# Altium project OFP_MCM_v1.6.PrjPcb (part 7 of 7)
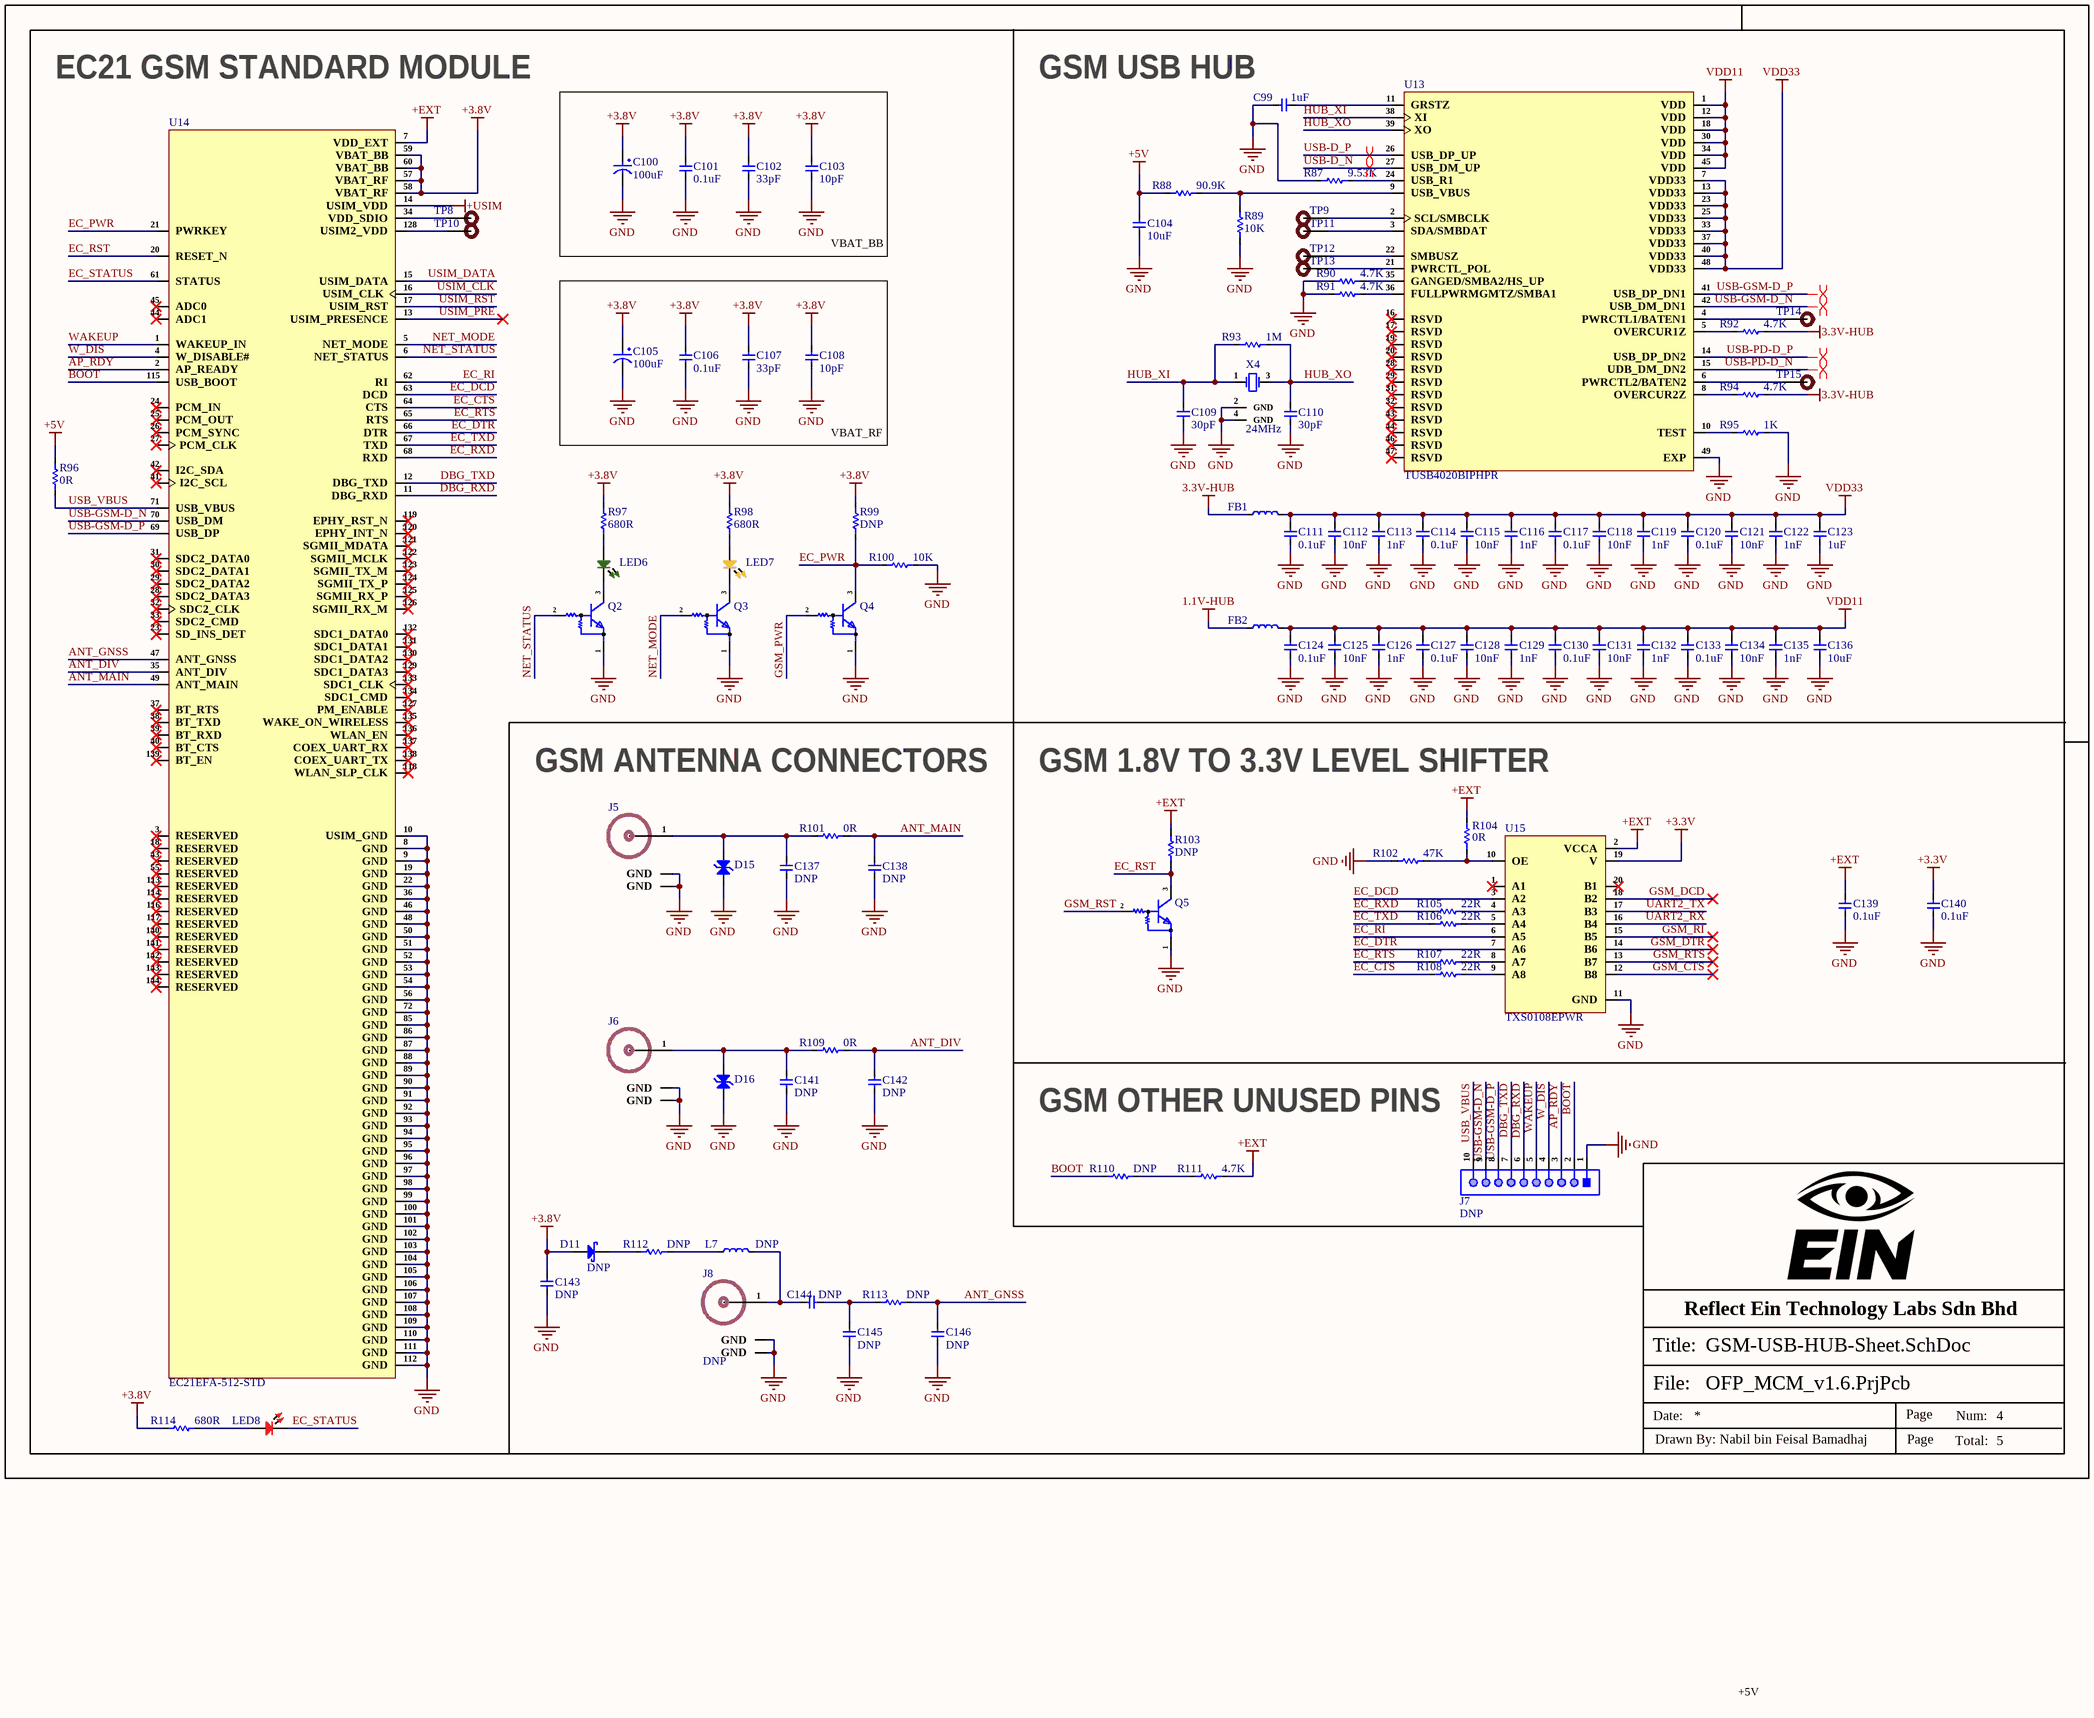
[diagram p10: GSM-USB-HUB-Sheet.SchDoc]

## Sheet GSM-USB-HUB-Sheet.SchDoc (continued)

### Library data of the parts (continued)
R102 = RC0603FR-0747KL: RES 47K OHM 1% 1/10W 0603; Manufacturer: Yageo; Item Type: Resistors; Value: 47kR; Temperature Coefficient: 100ppm/°C; Voltage Rating (DC): 50V; Power Rating: 100mW; Supplier: Rs; LCSC Part Number: C105579; Manufacturer Part Number: RC0603FR-0747KL; RoHS: Yes; Stock: 3100; Pricing: 100=0.078, 1000=0.071, 2500=0.068, 5000=0.062, 10000=0.057 (SEK); Case/Package: 0603; Pins: 2; Case Code (Metric): 1608; Case Code (Imperial): 0603; Min Operating Temperature: -55°C; Max Operating Temperature: 155°C; Tolerance: 1%; Resistor Type: Thick Film; Packaging: Tape and Reel; Voltage Rating: 50V; Package Quantity: 1; Number of Terminations: 2; Termination: SMD/SMT; Max Power Dissipation: 100mW; Features: Moisture Resistant; Series: RC; Resistance Tolerance: 1%; Technology: THICK FILM; Voltage Rating (AC): 50V; Length: 0.063inch; Width: 0.031inch; Height: 0.022inch; Depth: 0.8mm; Radiation Hardening: 5898YesNo; Reach SVHC Compliant: Unknown; Lead Free: 5697LeadFree; RoHS Compliant: Yes
R104 R110 = RC0603FR-070RL: as R39 on sheet Power-Sheet; Manufacturer Part Number: RC0603FR-070RL; Package: 0603; LCSC Part Number: C100044; ComponentLink9Description: LCSC; ComponentLink9URL: https://www.lcsc.com/product-detail/Chip-Resistor-Surface-Mount_YAGEO-RC0603FR-070RL_C100044.html
R105-R108 = RC0603FR-0722RL: RES 22 OHM 1% 1/10W 0603; Manufacturer: Yageo; Temperature Coefficient: 100ppm/°C; Voltage Rating (DC): 50V; Power Rating: 100mW; Item Type: Resistor; Supplier 1: Avnet; Manufacturer Part Number: RC0603FR-0722RL; RoHS: Yes; Category: Chip SMD Resistors; Stock 1: 190000; Pricing 1: 5000=0.00133, 10000=0.00131, 20000=0.00127 (USD); Case/Package: 0603; Number of Pins: 2; Case Code (Metric): 1608; Case Code (Imperial): 0603; Size Code: 0603; Min Operating Temperature: -55°C; Max Operating Temperature: 155°C; Tolerance: 1%; Resistance: 22R; Resistor Type: Thick Film; Packaging: Tape and Reel; Voltage Rating: 50V; Package Quantity: 1; Number of Terminations: 2; Termination: SMD/SMT; Max Power Dissipation: 100mW; Features: Moisture Resistant; Series: RC; Resistance Tolerance: 1%; Technology: THICK FILM; Construction: Rectangular; Length: 0.063inch; Width: 0.031inch; Height: 0.022inch; Depth: 0.8mm; Reach SVHC Compliant: Yes; Lead Free: Lead Free; Military Standard: Not; RoHS Compliant: Yes; ComponentLink1URL: https://datasheet.ciiva.com/11819/0900766b80f96399-11819285.pdf?src-supplier=RSComponents; ComponentLink1Description: https://datasheet.ciiva.com/11819/0900766b80f96399-11819285.pdf?src-supplier=RSComponents; ComponentLink2URL: https://datasheet.ciiva.com/46395/443971-46395032.pdf?src-supplier=Element14; ComponentLink2Description: https://datasheet.ciiva.com/46395/443971-46395032.pdf?src-supplier=Element14; ComponentLink3URL: https://datasheet.ciiva.com/46440/1868787-46440901.pdf?src-supplier=Element14; ComponentLink3Description: https://datasheet.ciiva.com/46440/1868787-46440901.pdf?src-supplier=Element14; ComponentLink4URL: https://datasheet.ciiva.com/2454/pyu-r-int-thick-7-2454355.pdf?src-supplier=Digi-Key; ComponentLink4Description: https://datasheet.ciiva.com/2454/pyu-r-int-thick-7-2454355.pdf?src-supplier=Digi-Key; ComponentLink5URL: https://datasheet.ciiva.com/2454/pyu-r-int-thick-7-2454356.pdf?src-supplier=Digi-Key; ComponentLink5Description: https://datasheet.ciiva.com/2454/pyu-r-int-thick-7-2454356.pdf?src-supplier=Digi-Key; ComponentLink6URL: https://datasheet.ciiva.com/2454/pyu-r-int-thick-7-2454354.pdf?src-supplier=Digi-Key; ComponentLink6Description: https://datasheet.ciiva.com/2454/pyu-r-int-thick-7-2454354.pdf?src-supplier=Digi-Key; Supplier Part Number 1: RC0603FR-0722RL; LCSC Part Number: C107701
R111 = RC0603FR-074K7L: RES SMD 4.7K OHM 1% 1/10W 0603; Manufacturer: Yageo; Item Type: Resistor; Manufacturer Part Number: RC0603FR-074K7L; Package: 0603; ComponentLink7Description: LCSC; ComponentLink7URL: https://www.lcsc.com/product-detail/Chip-Resistor-Surface-Mount_YAGEO-RC0603FR-074K7L_C99782.html; LCSC Part Number: C99782
R112 = RC0603FR-0710RL: RES SMD 10 OHM 1% 1/10W 0603; Manufacturer: Yageo; Resistance: 10R; Temperature Coefficient: 200ppm/°C; Power Rating: 100mW; Voltage Rating: 50V; Item type: Resistor; Supplier 1: Digi-Key; Manufacturer Part Number: RC0603FR-0710RL; Stock 1: 10836596; Pricing 1: 1=0.1, 10=0.046, 100=0.0187, 1000=0.0084, 2500=0.00729 (USD); Case/Package: 0603; Number of Pins: 2; Case Code (Imperial): 0603; Case Code (Metric): 1608; Contact Plating: Tin,Matte; Min Operating Temperature: -55°C; Max Operating Temperature: 155°C; Tolerance: 1%; Composition: Thick Film; Packaging: Tape and Reel; Voltage Rating (DC): 50V; Termination: SMD/SMT; Military Standard: Not; Length: 1.6mm; Height: 0.45mm; Width: 0.8mm; Depth: 0.8mm; Radiation Hardening: No; Lead Free: Lead Free; REACH SVHC: No SVHC; ComponentLink1URL: http://www.farnell.com/datasheets/1868787.pdf?src-supplier=Element14; ComponentLink1Description: http://www.farnell.com/datasheets/1868787.pdf?src-supplier=Element14; ComponentLink2URL: http://www.yageo.com/documents/recent/PYu-RC0603_51_RoHS_L_4.pdf?src-supplier=Avnet; ComponentLink2Description: http://www.yageo.com/documents/recent/PYu-RC0603_51_RoHS_L_4.pdf?src-supplier=Avnet; ComponentLink3URL: http://documents.rs-components.com/techlib://itc_doclist_GB.htm?stockno=5048984&src-supplier=RSComponents; ComponentLink3Description: http://documents.rs-components.com/techlib://itc_doclist_GB.htm?stockno=5048984&src-supplier=RSComponents; ComponentLink4URL: http://www.yageo.com/documents/recent/PYu-RC0603_51_RoHS_L_4.pdf?src-supplier=Avnet+Europe; ComponentLink4Description: http://www.yageo.com/documents/recent/PYu-RC0603_51_RoHS_L_4.pdf?src-supplier=Avnet+Europe; Supplier Part Number 1: 311-10.0HRDKR-ND; LCSC Part Number: C109318
R113 = RC0402FR-070RL: RES 0 OHM JUMPER 1/16W 0402; Manufacturer: Yageo; Item Type: Resistors; Resistance: 0R; Tolerance: 1%; Power Rating: 62.5mW; Voltage Rating: 50V; Temperature Coefficient: 200ppm/°C; Max Power Dissipation: 63mW; Supplier 1: Mouser; Manufacturer Part Number: RC0402FR-070RL; RoHS: Yes; Stock 1: 8556842; Pricing 1: 1=0.10000, 10=0.01400, 50=0.01400, 100=0.00600, 1000=0.00300, 5000=0.00200, 10000=0.00100 (USD); Mount: Surface Mount; Case/Package: 0402; Contact Plating: Tin,Matte; Case Code (Imperial): 0402; Case Code (Metric): 1005; Size Code: 0402; Min Operating Temperature: -55°C; Max Operating Temperature: 155°C; Resistor Type: Thick Film; Packaging: Tape and Reel; Termination: SMD/SMT; Features: Moisture Resistant; Series: RC; Number of Terminations: 2; Length: 1mm; Width: 0.5mm; Height: 0.35mm; Radiation Hardening: No; Lead Free: Lead Free; RoHS Compliant: Yes; ComponentLink1URL: https://datasheet.ciiva.com/8896/pyu-rc0402-51-rohs-l-6-8896149.pdf?src-supplier=Avnet; ComponentLink1Description: https://datasheet.ciiva.com/8896/pyu-rc0402-51-rohs-l-6-8896149.pdf?src-supplier=Avnet; ComponentLink2URL: https://datasheet.ciiva.com/16790/pyu-rc0402-51-rohs-l-6-r-16790444.pdf?src-supplier=Future+Electronics; ComponentLink2Description: https://datasheet.ciiva.com/16790/pyu-rc0402-51-rohs-l-6-r-16790444.pdf?src-supplier=Future+Electronics; Supplier Part Number 1: 603-RC0402FR-070RL; LCSC Part Number: C106231
TP8-TP15 = TEST POINT 0.5mm Dia: Test Point ON; Item Type: Test Point; Manufacturer Part Number: TEST POINT 0.5mm Dia
U13 = TUSB4020BIPHPR: IC USB 2.0 2PORT HUB IND 48HTQFP; Manufacturer: Texas Instruments; Supplier: Mouser; LCSC Part Number: C2864320; Manufacturer Part Number: TUSB4020BIPHPR; RoHS: Yes; Item Type: IC; Stock: 2703; Pricing: 1=4.5, 10=3.15, 50=3.15, 100=2.85, 1000=2.55, 10000=2.52 (USD); ComponentLink1URL: http://www.ti.com/lit/ds/symlink/tusb4020bi.pdf?src-supplier=Digikey; ComponentLink1Description: http://www.ti.com/lit/ds/symlink/tusb4020bi.pdf?src-supplier=Digikey; ComponentLink2URL: http://www.ti.com/general/docs/suppproductinfo.tsp?distId=10&amp;gotoUrl=http%3A%2F%2Fwww.ti.com%2Flit%2Fgpn%2Ftusb4020bi&src-supplier=Digikey; ComponentLink2Description: http://www.ti.com/general/docs/suppproductinfo.tsp?distId=10&amp;gotoUrl=http%3A%2F%2Fwww.ti.com%2Flit%2Fgpn%2Ftusb4020bi&src-supplier=Digikey
U14 = EC21EFA-512-STD: RF TXRX MOD CELLULARCARD EDGE; Manufacturer: Quectel Wireless Solutions; Item Type: IC; Supplier: Mouser; Supplier Part Number: 277-EC21EFA-512-STD; Manufacturer Part Number: EC21EFA-512-STD; RoHS: No; Stock: 210; Pricing: 1=59.46, 10=47.77, 50=42.24, 100=40.31, 1000=38.16, 10000=38.16 (USD); ComponentLink1URL: https://datasheet.octopart.com/EC21EFA-512-STD-Quectel-datasheet-163886073.pdf?src-supplier=SOS+electronic; ComponentLink1Description: https://datasheet.octopart.com/EC21EFA-512-STD-Quectel-datasheet-163886073.pdf?src-supplier=SOS+electronic
U15 = TXS0108EPWR: IC TRANSLATOR BIDIR 20TSSOP; Manufacturer: Texas Instruments; Manufacturer Part Number: TXS0108EPWR; Package: 20-TSSOP; LCSC Part Number: C17206; Item Type: IC; ComponentLink1Description: LCSC; ComponentLink1URL: https://www.lcsc.com/product-detail/Translators-Level-Shifters_Texas-Instruments-TXS0108EPWR_C17206.html
X4 = X503224MSB4SI: 24MHz Surface Mount Crystal 20pF ±10ppm ±20ppm SMD5032-4P Crystals ROHS; Manufacturer: YXC; Supplier: LCSC; LCSC Part Number: C112587; Manufacturer Part Number: X503224MSB4SI; RoHS: No; Item Type: Crystal; Stock: 390; Pricing: 5=0.2572, 50=0.2054, 150=0.1832, 1000=0.1377, 2000=0.1253, 5000=0.1179 (USD)

## Sheet Others-Sheet.SchDoc
size 420 x 297 mm; SheetNumber: 5; SheetTotal: 5
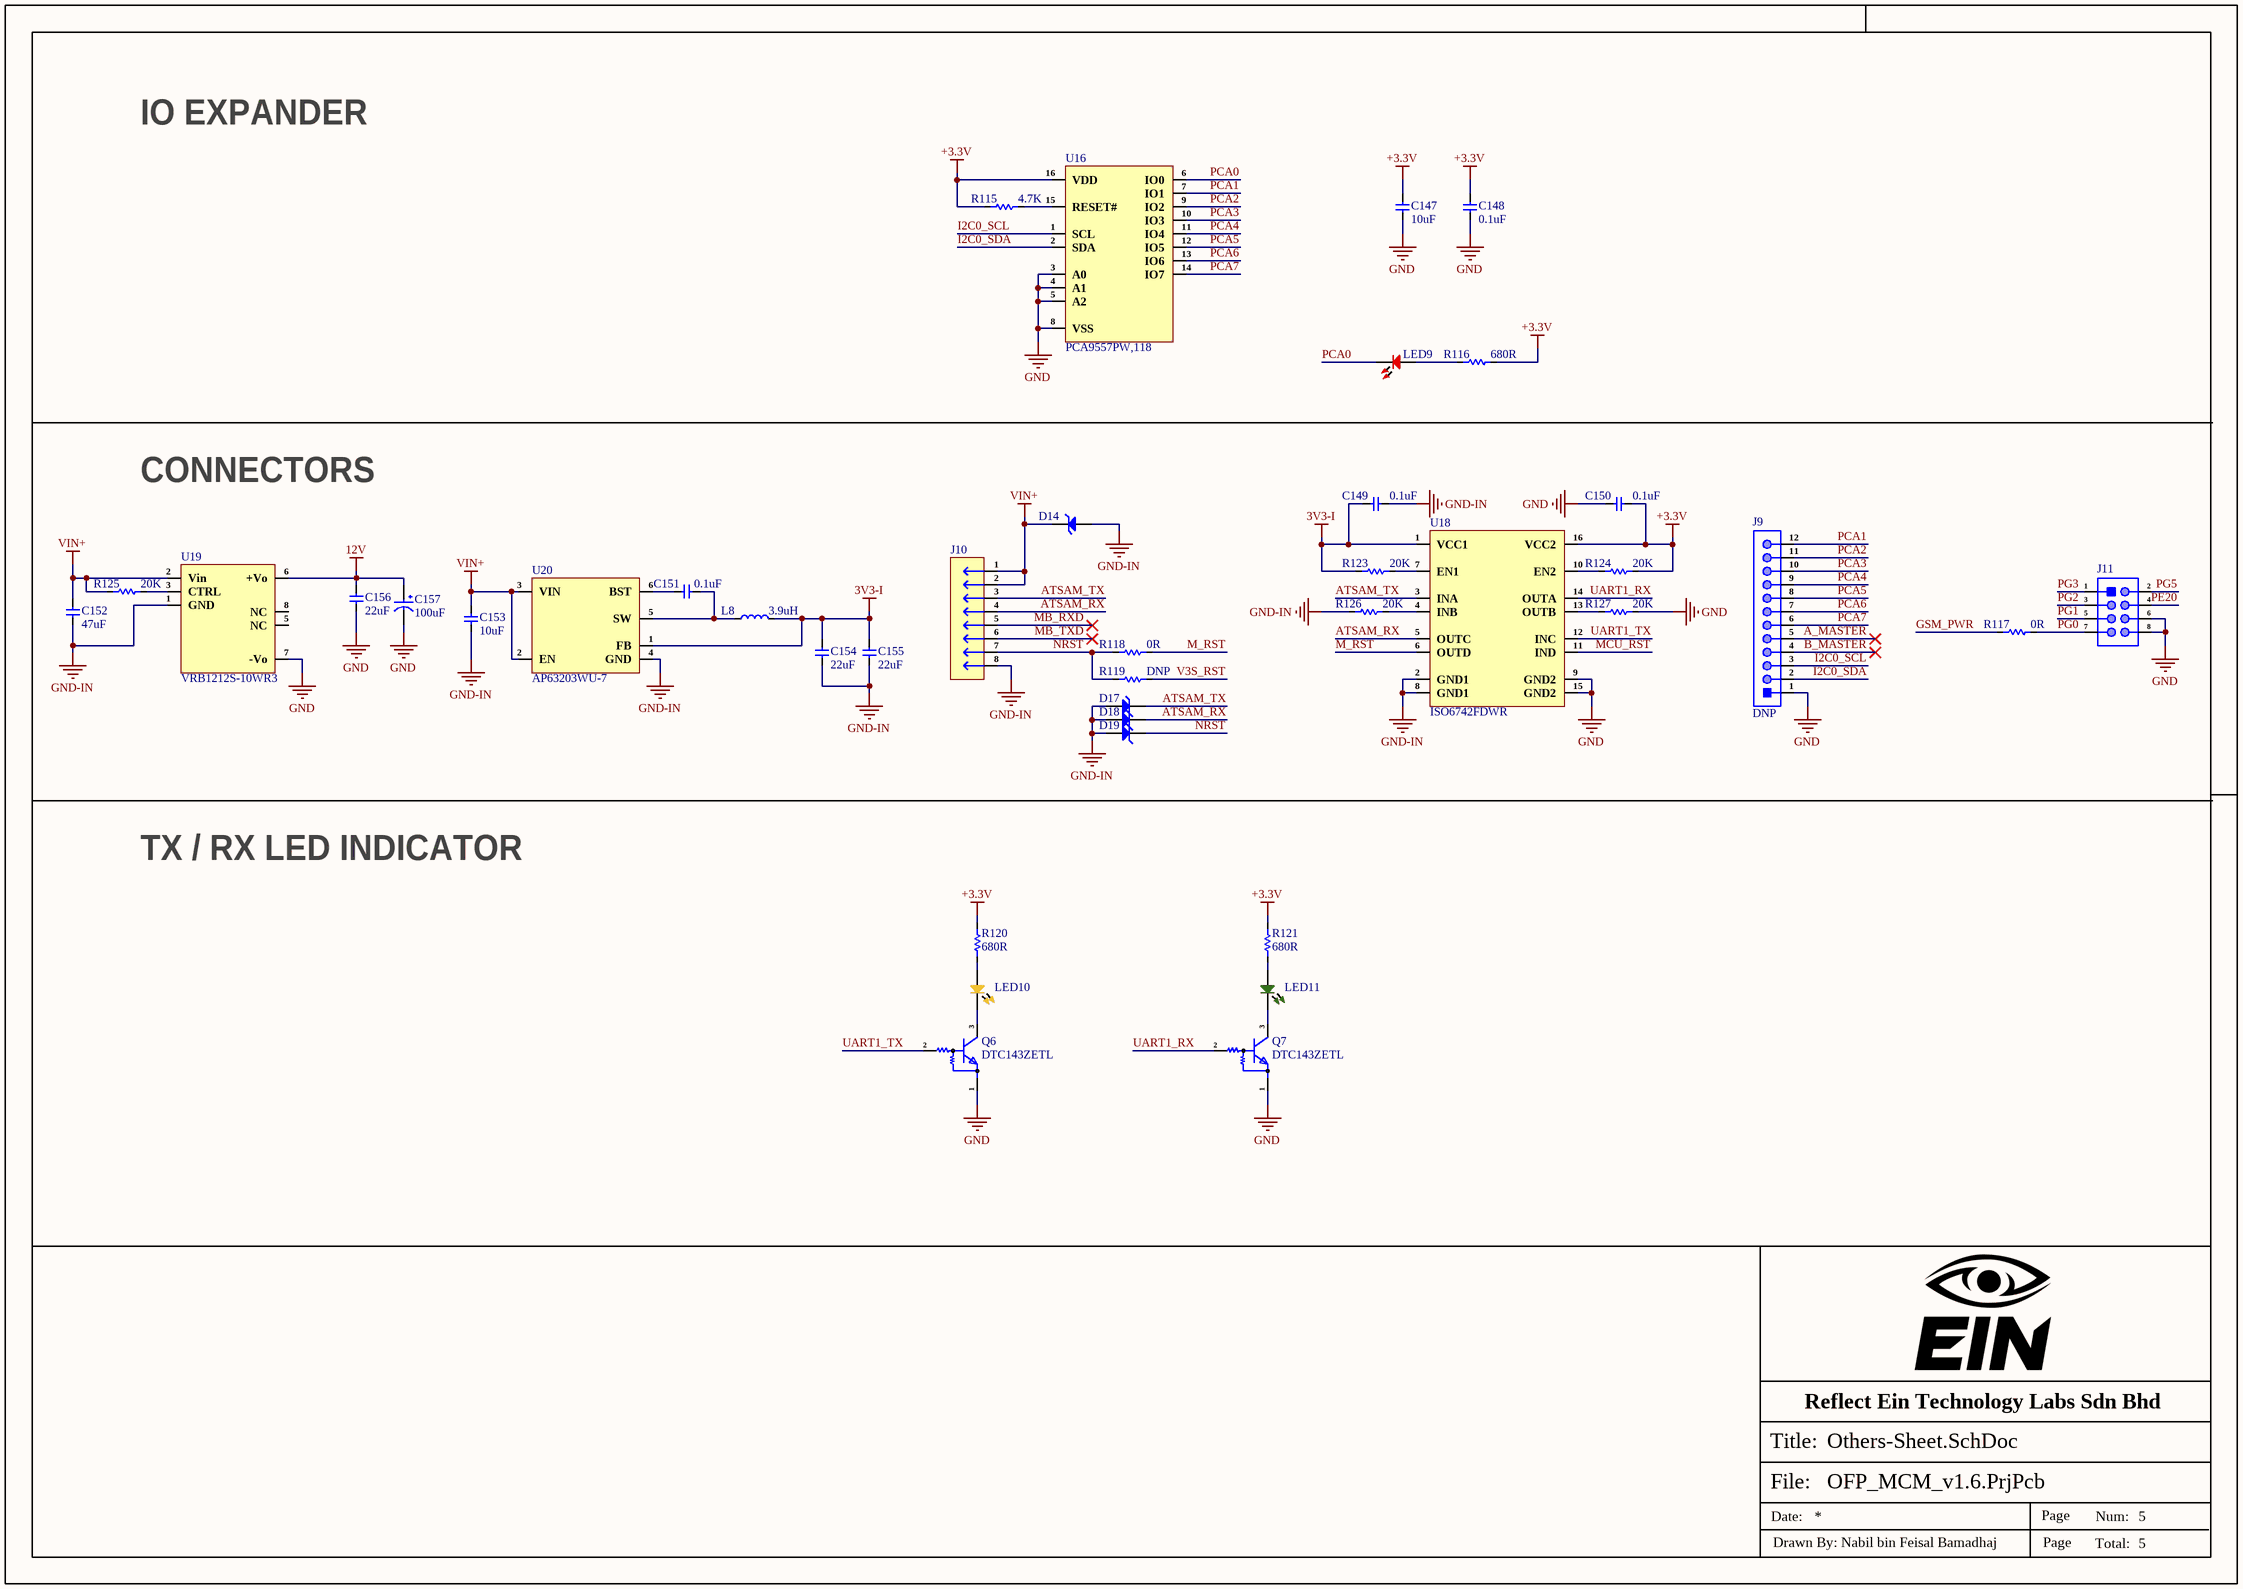
[diagram p4: Others-Sheet.SchDoc]

### Parts
C147  10uF  [Cap-0603]
C148  0.1uF  [Cap-0402]
C149  0.1uF  [Cap-0402]
C150  0.1uF  [Cap-0402]
C151  0.1uF  [Cap-0603]
C152  47uF  [Cap-1206]
C153  10uF  [Cap-1210]
C154  22uF  [Cap-0805]
C155  22uF  [Cap-0805]
C156  22uF  [Cap-0805]
C157  100uF  [Case-E]
D14  SMBJ12A  [SMB_]  (value not drawn)
D17  SMF3.3  [SOD-123FL]  (value not drawn)
D18  SMF3.3  [SOD-123FL]  (value not drawn)
D19  SMF3.3  [SOD-123FL]  (value not drawn)
J9  DNP  [HDR 1x12 TH]
J10  B8B-XH-A(LF)(SN)  [B8B-XH-A(LF)(SN)]  (value not drawn)
J11  X6521WV-2x04H-C60D30  [HDR 2X4 (2.54mm Male)]  (value not drawn)
L8  3.9uH  [FNR4030S3R9MT]
LED9  RED  [LED-0603]  (value not drawn)
LED10  Yellow  [LED-0603]  (value not drawn)
LED11  GREEN  [TH LED 5mm Green]  (value not drawn)
Q6  DTC143ZETL  [SOT-416]
Q7  DTC143ZETL  [SOT-416]
R115  4.7K  [Res-0402]
R116  680R  [Res-0402]
R117  0R  [Res-0402]
R118  0R  [Res-0603]
R119  DNP  [Res-0603]
R120  680R  [Res-0603]
R121  680R  [Res-0603]
R123  20K  [Res-0603]
R124  20K  [Res-0603]
R125  20K  [Res-0603]
R126  20K  [Res-0603]
R127  20K  [Res-0603]
U16  PCA9557PW,118  [TSSOP_16]
U18  ISO6742FDWR  [SOIC-16-300mil]
U19  VRB1212S-10WR3  [VRB1212S-10WR3]
U20  AP63203WU-7  [TSOT-23-6]

### Nets
3V3-I: C149.2 C154.2 C155.2 L8.2 R123.1 U18.1(VCC1) U20.1(FB)
12V: C156.2 C157.1 U19.6(+Vo)
+3.3V: C147.2 C148.2 C150.1 R115.1 R116.2 R120.2 R121.2 R124.2 U16.16(VDD) U18.16(VCC2)
GND: C147.1 C148.1 C150.2 C156.1 C157.2 J9.1 J11.6 J11.8 Q6.1(E) Q7.1(E) R127.2 U16.3(A0) U16.4(A1) U16.5(A2) U16.8(VSS) U18.9(GND2) U18.15(GND2) U19.7(-Vo)
GND-IN: C149.1 C152.1 C153.1 C154.1 C155.1 D14.1(A) D17.2(A) D18.2(A) D19.2(A) J10.8 R126.1 U18.2(GND1) U18.8(GND1) U19.1(GND) U20.4(GND)
V3S_RST: R119.2
VIN+: C152.2 C153.2 D14.2(K) J10.1 J10.2 R125.1 U19.2(Vin) U20.2(EN) U20.3(VIN)
A_MASTER: J9.5
ATSAM_RX: D18.1(K) J10.4 U18.5(OUTC)
ATSAM_TX: D17.1(K) J10.3 U18.3(INA)
B_MASTER: J9.4
GSM_PWR: R117.1
I2C0_SCL: J9.3 U16.1(SCL)
I2C0_SDA: J9.2 U16.2(SDA)
M_RST: R118.2 U18.6(OUTD)
MB_RXD: J10.5
MB_TXD: J10.6
MCU_RST: U18.11(IND)
NRST: D19.1(K) J10.7 R118.1 R119.1
PCA0: LED9.2 U16.6(IO0)
PCA1: J9.12 U16.7(IO1)
PCA2: J9.11 U16.9(IO2)
PCA3: J9.10 U16.10(IO3)
PCA4: J9.9 U16.11(IO4)
PCA5: J9.8 U16.12(IO5)
PCA6: J9.7 U16.13(IO6)
PCA7: J9.6 U16.14(IO7)
PE20: J11.4
PG0: J11.7 R117.2
PG1: J11.5
PG2: J11.3
PG3: J11.1
PG5: J11.2
UART1_RX: Q7.2(B) U18.14(OUTA)
UART1_TX: Q6.2(B) U18.12(INC)
NetC151_1: C151.1 U20.6(BST)
NetC151_2: C151.2 L8.1 U20.5(SW)
NetLED9_1: LED9.1 R116.1
NetLED10_1: LED10.1 R120.1
NetLED10_2: LED10.2 Q6.3(C)
NetLED11_1: LED11.1 Q7.3(C)
NetLED11_2: LED11.2 R121.1
NetR115_2: R115.2 U16.15(RESET#)
NetR123_2: R123.2 U18.7(EN1)
NetR124_1: R124.1 U18.10(EN2)
NetR125_2: R125.2 U19.3(CTRL)
NetR126_2: R126.2 U18.4(INB)
NetR127_1: R127.1 U18.13(OUTB)

Not connected (* = marked no-connect by the designer): U19 5(NC) 8(NC)

### Notes on the sheet
- IO EXPANDER
- CONNECTORS
- TX / RX LED INDICATOR
- Reflect Ein Technology Labs Sdn Bhd
- File:
- Title:
- Date:
- Page
- Num:
- Total:
- Drawn By: Nabil bin Feisal Bamadhaj

### Library data of the parts
C147 = GRM188Z71A106KA73D: CAP CER 10UF 10V X7R 0603; Manufacturer: Murata; Item Type: Capacitor; Material: 4241ConductorMaterial; Tolerance: 10%; Supplier: Mouser; LCSC Part Number: C2959727; Manufacturer Part Number: GRM188Z71A106KA73D; RoHS: Yes; Stock: 390983; Pricing: 1=0.36, 10=0.155, 50=0.155, 100=0.104, 1000=0.094, 10000=0.065 (USD); Case/Package: 345Case; Min Operating Temperature: -55°C; Max Operating Temperature: 125°C; Value: 10uF; Voltage Rating: 10V; Length: 1.6mm; Width: 800um; Height: 1mm; Thickness: 800um; RoHS Compliant: Yes; ComponentLink1URL: https://datasheet.octopart.com/GRM188Z71A106KA73D-Murata-datasheet-165579666.pdf?src-supplier=TME; ComponentLink1Description: https://datasheet.octopart.com/GRM188Z71A106KA73D-Murata-datasheet-165579666.pdf?src-supplier=TME
C148-C150 = GRM155R71E104KE14D: CAP CER 0.1UF 25V X7R 0402; Manufacturer: Murata; Item Type: Capacitors; Dielectric Material: Ceramic; Material: 4241ConductorMaterial; Value: 100nF; Tolerance: 10%; Supplier: Mouser; LCSC Part Number: C77014; Manufacturer Part Number: GRM155R71E104KE14D; RoHS: Yes; Stock: 652368; Pricing: 1=0.1, 10=0.007, 50=0.007, 100=0.005, 1000=0.005, 10000=0.004 (USD); Mounting Technology: Surface Mount; Case/Package: 0402; Pins: 2NUMBER; Case Code (Metric): 1005; Case Code (Imperial): 0402; Weight: 0.000212oz; Min Operating Temperature: -55°C; Max Operating Temperature: 125°C; Packaging: Tape and Reel; Voltage Rating: 25V; Dielectric: X7R; Voltage: 25V; Termination: SMD/SMT; Voltage Rating (DC): 25V; Package Quantity: 10000; Series: GRM; Length: 1mm; Width: 0.02inch; Height: 0.5mm; Thickness: 0.022inch; Depth: 0.5mm; RoHS Compliant: Yes; Reach SVHC Compliant: Unknown; Lead Free: 5697LeadFree; ComponentLink1URL: http://www.farnell.com/datasheets/1872206.pdf?src-supplier=Farnell; ComponentLink1Description: http://www.farnell.com/datasheets/1872206.pdf?src-supplier=Farnell; ComponentLink2URL: http://www.mouser.com/ds/2/281/c02e-2905.pdf?src-supplier=Mouser; ComponentLink2Description: http://www.mouser.com/ds/2/281/c02e-2905.pdf?src-supplier=Mouser; ComponentLink3URL: http://uk.rs-online.com/webdocs/144c/0900766b8144c113.pdf?src-supplier=Rs; ComponentLink3Description: http://uk.rs-online.com/webdocs/144c/0900766b8144c113.pdf?src-supplier=Rs; ComponentLink4URL: https://datasheet.octopart.com/GRM155R71E104KE14D-Murata-datasheet-62346597.pdf?src-supplier=Future+Electronics; ComponentLink4Description: https://datasheet.octopart.com/GRM155R71E104KE14D-Murata-datasheet-62346597.pdf?src-supplier=Future+Electronics; ComponentLink5URL: https://search.murata.co.jp/Ceramy/image/img/A01X/G101/ENG/GRM155R71E104KE14-01.pdf?src-supplier=Digikey; ComponentLink5Description: https://search.murata.co.jp/Ceramy/image/img/A01X/G101/ENG/GRM155R71E104KE14-01.pdf?src-supplier=Digikey; ComponentLink6URL: http://www.farnell.com/datasheets/2048008.pdf?src-supplier=Newark; ComponentLink6Description: http://www.farnell.com/datasheets/2048008.pdf?src-supplier=Newark; ComponentLink7URL: https://datasheet.octopart.com/GRM155R71E104KE14D-Murata-datasheet-62317124.pdf?src-supplier=Element14; ComponentLink7Description: https://datasheet.octopart.com/GRM155R71E104KE14D-Murata-datasheet-62317124.pdf?src-supplier=Element14; ComponentLink8URL: http://psearch.en.murata.com/capacitor/product/GRM155R71E104KE14%23.pdf?src-supplier=Avnet; ComponentLink8Description: http://psearch.en.murata.com/capacitor/product/GRM155R71E104KE14%23.pdf?src-supplier=Avnet
C151 = GCJ188R71H104KA12D: CAP CER 0.1UF 50V X7R 0603; Manufacturer: Murata; Item Type: Capacitors; Material: 4241ConductorMaterial; Value: 100nF; Tolerance: 10%; Supplier: Mouser; LCSC Part Number: C161115; Manufacturer Part Number: GCJ188R71H104KA12D; RoHS: Yes; Stock: 342536; Pricing: 1=0.13, 10=0.056, 50=0.056, 100=0.036, 1000=0.032, 10000=0.02 (USD); Mounting Technology: Surface Mount; Case/Package: 0603; Case Code (Metric): 1608; Case Code (Imperial): 0603; Min Operating Temperature: -55°C; Max Operating Temperature: 125°C; Dielectric: X7R; Package Quantity: 1; Voltage Rating: 50V; Packaging: Tape and Reel; Voltage Rating (DC): 50V; Termination: SMD/SMT; Features: Soft Termination; Series: GCJ; Construction: Flat; Length: 1.6mm; Width: 0.031inch; Height: 0.8mm; Thickness: 0.035inch; Depth: 0.8mm; Ratings: AEC-Q200; Radiation Hardening: No; RoHS Compliant: Yes; Lead Free: 5697LeadFree; ComponentLink1URL: https://datasheet.ciiva.com/135/product-135604.pdf?src-supplier=Digikey; ComponentLink1Description: https://datasheet.ciiva.com/135/product-135604.pdf?src-supplier=Digikey; ComponentLink2URL: https://datasheet.ciiva.com/26889/getdatasheetpartid-369886-26889118.pdf?src-supplier=Verical; ComponentLink2Description: https://datasheet.ciiva.com/26889/getdatasheetpartid-369886-26889118.pdf?src-supplier=Verical; ComponentLink3URL: https://datasheet.ciiva.com/135/s0717e-135605.pdf?src-supplier=Digikey; ComponentLink3Description: https://datasheet.ciiva.com/135/s0717e-135605.pdf?src-supplier=Digikey; ComponentLink4URL: https://datasheet.ciiva.com/135/s0717e-135606.pdf?src-supplier=Digikey; ComponentLink4Description: https://datasheet.ciiva.com/135/s0717e-135606.pdf?src-supplier=Digikey; ComponentLink5URL: https://datasheet.ciiva.com/16440/c03e-16440425.pdf?src-supplier=Future+Electronics; ComponentLink5Description: https://datasheet.ciiva.com/16440/c03e-16440425.pdf?src-supplier=Future+Electronics
C152 = C3216X5R1E476M160AC: CAP CER 47UF 25V X5R 1206; Manufacturer: TDK; Dielectric Material: Ceramic; Tolerance: 20%; Supplier 1: Digi-Key; Manufacturer Part Number: C3216X5R1E476M160AC; Stock 1: 886163; Pricing 1: 1=1.09, 10=0.862, 50=0.7476, 100=0.6469, 500=0.48876, 1000=0.43125 (USD); Mount: Surface Mount; Case/Package: 1206; Case Code (Metric): 3216; Case Code (Imperial): 1206; Weight: 0.000571oz; Min Operating Temperature: -55°C; Max Operating Temperature: 85°C; Capacitance: 47uF; Voltage Rating: 25V; Packaging: Tape and Reel; Voltage Rating (DC): 25V; Termination: SMD/SMT; Series: C; Package Quantity: 1; Dielectric: X5R; Resistor Type: Ceramic; Voltage: 25V; Length: 0.126inch; Width: 0.063inch; Height: 1.6mm; Depth: 1.6mm; Thickness: 0.071inch; Lead Free: Lead Free; REACH SVHC: No SVHC; ComponentLink1URL: https://product.tdk.com/info/en/catalog/datasheets/mlcc_commercial_general_en.pdf?src-supplier=Digi-Key; ComponentLink1Description: https://product.tdk.com/info/en/catalog/datasheets/mlcc_commercial_general_en.pdf?src-supplier=Digi-Key; ComponentLink2URL: https://product.tdk.com/info/en/documents/chara_sheet/C3216X5R1E476M160AC.pdf?src-supplier=Digi-Key; ComponentLink2Description: https://product.tdk.com/info/en/documents/chara_sheet/C3216X5R1E476M160AC.pdf?src-supplier=Digi-Key; ComponentLink3URL: http://www.tdk.com/pdf/general_B11.pdf?src-supplier=Future+Electronics; ComponentLink3Description: http://www.tdk.com/pdf/general_B11.pdf?src-supplier=Future+Electronics; Supplier Part Number 1: 445-8047-1-ND; LCSC Part Number: C2167787
C153 = GRM32ER71H106KA12L: CAP CER 10UF 50V X7R 1210; Manufacturer: Murata; Item Type: Capacitors; Supplier: Future Electronics; LCSC Part Number: C77102; Manufacturer Part Number: GRM32ER71H106KA12L; RoHS: Yes; Stock: 960000; Pricing: 1000=0.325, 2000=0.32, 3000=0.315, 4000=0.315, 5000=0.305 (USD); Lead Free: 5697LeadFree; RoHS Compliant: 5897YesNo; ComponentLink1URL: https://datasheet.ciiva.com/16497/product-16497010.pdf?src-supplier=Future+Electronics; ComponentLink1Description: https://datasheet.ciiva.com/16497/product-16497010.pdf?src-supplier=Future+Electronics; ComponentLink2URL: https://datasheet.ciiva.com/3777/4286grm32er71h106ka1223-3777306.pdf?src-supplier=Arrow+Electronics; ComponentLink2Description: https://datasheet.ciiva.com/3777/4286grm32er71h106ka1223-3777306.pdf?src-supplier=Arrow+Electronics; ComponentLink3URL: https://datasheet.ciiva.com/11789/0900766b80ef921d-11789081.pdf?src-supplier=Rs; ComponentLink3Description: https://datasheet.ciiva.com/11789/0900766b80ef921d-11789081.pdf?src-supplier=Rs; ComponentLink4URL: https://datasheet.ciiva.com/11607/c02e-11607596.pdf?src-supplier=Avnet; ComponentLink4Description: https://datasheet.ciiva.com/11607/c02e-11607596.pdf?src-supplier=Avnet; ComponentLink5URL: https://datasheet.ciiva.com/6270/partnumbering-e-01-6270167.pdf?src-supplier=Digikey; ComponentLink5Description: https://datasheet.ciiva.com/6270/partnumbering-e-01-6270167.pdf?src-supplier=Digikey; ComponentLink6URL: https://datasheet.ciiva.com/6270/partnumbering-e-01-6270168.pdf?src-supplier=Digikey; ComponentLink6Description: https://datasheet.ciiva.com/6270/partnumbering-e-01-6270168.pdf?src-supplier=Digikey; ComponentLink7URL: https://datasheet.ciiva.com/6270/partnumbering-e-01-6270169.pdf?src-supplier=Digikey; ComponentLink7Description: https://datasheet.ciiva.com/6270/partnumbering-e-01-6270169.pdf?src-supplier=Digikey; ComponentLink8URL: https://datasheet.ciiva.com/46441/1754714-46441340.pdf?src-supplier=Element14; ComponentLink8Description: https://datasheet.ciiva.com/46441/1754714-46441340.pdf?src-supplier=Element14
C154 C155 = GRM21BZ70J226ME44L: CAP CER 22UF 6.3V X7R 0805; Manufacturer: Murata; Item Type: Capacitors; Material: 4241ConductorMaterial; Tolerance: 20%; Supplier: Mouser; LCSC Part Number: C1517827; Manufacturer Part Number: GRM21BZ70J226ME44L; RoHS: Yes; Stock: 88243; Pricing: 1=0.41, 10=0.243, 50=0.243, 100=0.154, 1000=0.108, 10000=0.082 (USD); Case/Package: 339Case; Min Operating Temperature: -55°C; Max Operating Temperature: 125°C; Value: 22uF; Voltage Rating: 6.3V; Length: 2mm; Width: 1.25mm; Height: 1.45mm; Thickness: 1.25mm; RoHS Compliant: Yes
C156 = CC0805MKX5R8BB226: CAP CER 22UF 25V X5R 0805; Manufacturer: Yageo; Tolerance: 20%; Item Type: Capacitor; Supplier 1: Digi-Key; Manufacturer Part Number: CC0805MKX5R8BB226; RoHS: Yes; Category: Ceramic Capacitors; Stock 1: 64970; Pricing 1: 1=0.47000, 10=0.33300, 50=0.25140, 100=0.21900, 500=0.16222, 1000=0.13789 (USD); Mount: Surface Mount; Case/Package: 0805; Case Code (Metric): 2012; Case Code (Imperial): 0805; Weight: 0.000194oz; Min Operating Temperature: -55°C; Max Operating Temperature: 85°C; Packaging: Tape and Reel; Capacitance: 22uF; Voltage Rating: 25V; Dielectric: X5R; Termination: SMD/SMT; Voltage Rating (DC): 25V; Package Quantity: 3000; Length: 0.079inch; Width: 0.049inch; Height: 1.25mm; Thickness: 0.057inch; Lead Free: Lead Free; Halogen Free: Halogen Free; RoHS Compliant: Yes; ComponentLink1URL: http://www.mouser.com/ds/2/447/Yageo_UPY-GP_NP0_16V-to-50V_9-358835.pdf?src-supplier=Mouser; ComponentLink1Description: http://www.mouser.com/ds/2/447/Yageo_UPY-GP_NP0_16V-to-50V_9-358835.pdf?src-supplier=Mouser; ComponentLink2URL: http://www.yageo.com/documents/recent/UPY-GPHC_X5R_4V-to-50V_25.pdf?src-supplier=Digi-Key; ComponentLink2Description: http://www.yageo.com/documents/recent/UPY-GPHC_X5R_4V-to-50V_25.pdf?src-supplier=Digi-Key; Supplier Part Number 1: 311-1903-1-ND; LCSC Part Number: C784585
C157 = TAJE107M025RNJ: CAP TANT 100UF 20% 25V 2917; Manufacturer: Kyocera AVX; ESR (Equivalent Series Resistance): 300mR; Leakage Current: 25uA; Polarity: Polar; Dissipation Factor: 10%; Supplier 1: Mouser; Manufacturer Part Number: TAJE107M025RNJ; RoHS: Yes; Category: Tantalum Capacitors; Stock 1: 109; Pricing 1: 1=2.81000, 10=2.81000, 50=2.81000, 100=2.19000, 1000=1.76000, 10000=1.76000 (USD); Mount: Surface Mount; Case/Package: 2917; Number of Pins: 2; Case Code (Imperial): 2917; Case Code (Metric): 7343; Min Operating Temperature: -55°C; Max Operating Temperature: 125°C; Capacitance: 100uF; Tolerance: 20%; Packaging: Tape and Reel; Voltage Rating: 25V; Voltage Rating (DC): 25V; Features: General Purpose; Package Quantity: 1; Termination: SMD/SMT; Series: TAJ; Construction: Flat; Length: 7.3mm; Width: 4.3mm; Height: 4.3mm; Depth: 4.3mm; Height - Seated (Max): 0.169inch; Radiation Hardening: No; Lead Free: Lead Free; RoHS Compliant: Yes; REACH SVHC: No SVHC; ComponentLink1URL: https://datasheet.ciiva.com/26787/taje107m025rnj-26787048.pdf?src-supplier=IIIC; ComponentLink1Description: https://datasheet.ciiva.com/26787/taje107m025rnj-26787048.pdf?src-supplier=IIIC; ComponentLink2URL: https://datasheet.ciiva.com/265/taj-265541.pdf?src-supplier=Digi-Key; ComponentLink2Description: https://datasheet.ciiva.com/265/taj-265541.pdf?src-supplier=Digi-Key; ComponentLink3URL: https://datasheet.ciiva.com/265/taj-265542.pdf?src-supplier=Digi-Key; ComponentLink3Description: https://datasheet.ciiva.com/265/taj-265542.pdf?src-supplier=Digi-Key; ComponentLink4URL: https://datasheet.ciiva.com/265/taj-265540.pdf?src-supplier=Digi-Key; ComponentLink4Description: https://datasheet.ciiva.com/265/taj-265540.pdf?src-supplier=Digi-Key; ComponentLink5URL: https://datasheet.ciiva.com/28609/1719052-28609254.pdf?src-supplier=Element14; ComponentLink5Description: https://datasheet.ciiva.com/28609/1719052-28609254.pdf?src-supplier=Element14; ComponentLink6URL: https://datasheet.ciiva.com/11230/taj-11230456.pdf?src-supplier=Avnet; ComponentLink6Description: https://datasheet.ciiva.com/11230/taj-11230456.pdf?src-supplier=Avnet; ComponentLink7URL: https://datasheet.ciiva.com/17339/taj-17339677.pdf?src-supplier=Avnet+Europe; ComponentLink7Description: https://datasheet.ciiva.com/17339/taj-17339677.pdf?src-supplier=Avnet+Europe; ComponentLink8URL: https://datasheet.ciiva.com/22667/1719052-22667581.pdf?src-supplier=Element14; ComponentLink8Description: https://datasheet.ciiva.com/22667/1719052-22667581.pdf?src-supplier=Element14; Supplier Part Number 1: 581-TAJE107M025RNJ; LCSC Part Number: C7230
D14 = SMBJ12A: TVS DIODE 12VWM 19.9VC DO214AA; Manufacturer: Littelfuse; Item Type: TVS Diodes; Supplier: Digikey; LCSC Part Number: C151251; Manufacturer Part Number: SMBJ12A; RoHS: Yes; Stock: 39718; Pricing: 1=0.32, 10=0.215, 100=0.104 (USD); ComponentLink1URL: https://datasheet.ciiva.com/15143/getdatasheetpartid-185160-15143884.pdf?src-supplier=Verical; ComponentLink1Description: https://datasheet.ciiva.com/15143/getdatasheetpartid-185160-15143884.pdf?src-supplier=Verical; ComponentLink2URL: https://datasheet.ciiva.com/34302/1546611-34302457.pdf?src-supplier=Jameco; ComponentLink2Description: https://datasheet.ciiva.com/34302/1546611-34302457.pdf?src-supplier=Jameco; ComponentLink3URL: https://datasheet.ciiva.com/25624/0900766b810f4eeb-25624681.pdf?src-supplier=Rs; ComponentLink3Description: https://datasheet.ciiva.com/25624/0900766b810f4eeb-25624681.pdf?src-supplier=Rs; ComponentLink4URL: https://datasheet.ciiva.com/16287/littelfuse-tvs-diode-smbj-16287565.pdf?src-supplier=Future+Electronics; ComponentLink4Description: https://datasheet.ciiva.com/16287/littelfuse-tvs-diode-smbj-16287565.pdf?src-supplier=Future+Electronics; ComponentLink5URL: https://datasheet.ciiva.com/331/littelfuse-tvs-diode-smbj-datasheet-pdf-331137.pdf?src-supplier=Digikey; ComponentLink5Description: https://datasheet.ciiva.com/331/littelfuse-tvs-diode-smbj-datasheet-pdf-331137.pdf?src-supplier=Digikey; ComponentLink6URL: https://datasheet.ciiva.com/331/littelfuse-tvs-diode-smbj-datasheet-pdf-331138.pdf?src-supplier=Digikey; ComponentLink6Description: https://datasheet.ciiva.com/331/littelfuse-tvs-diode-smbj-datasheet-pdf-331138.pdf?src-supplier=Digikey; ComponentLink7URL: https://datasheet.ciiva.com/331/littelfuse-tvs-diode-smbj-datasheet-pdf-331139.pdf?src-supplier=Digikey; ComponentLink7Description: https://datasheet.ciiva.com/331/littelfuse-tvs-diode-smbj-datasheet-pdf-331139.pdf?src-supplier=Digikey; ComponentLink8URL: https://datasheet.ciiva.com/8062/littelfuse-tvs-diode-smbj-8062301.pdf?src-supplier=Element14; ComponentLink8Description: https://datasheet.ciiva.com/8062/littelfuse-tvs-diode-smbj-8062301.pdf?src-supplier=Element14
D17-D19 = SMF3.3: TVS DIODE 3.3VWM 6.8VC SOD123F; Manufacturer: Littelfuse; Item Type: TVS Diodes; Breakdown Voltage: 3.4V; Direction: 210Direction; Number of Unidirectional Channels: 1; Reverse Standoff Voltage: 3.3V; Peak Pulse Current: 30A; Peak Pulse Power: 200W; Power Line Protection: No; Diode Type: ZENER; Number of Channels: 1NUMBER; Max Breakdown Voltage: 4.3V; Max Reverse Leakage Current: 500nA; Test Current: 10mA; Supplier: Digikey; LCSC Part Number: C2649858; Manufacturer Part Number: SMF3.3; RoHS: Yes; Stock: 66904; Pricing: 1=0.49, 10=0.313, 100=0.171, 500=0.153, 1000=0.151 (USD); Mounting Technology: Surface Mount; Min Operating Temperature: -55°C; Max Operating Temperature: 150°C; Packaging: Cut Tape; Series: SMF; Min Breakdown Voltage: 3.4V; Reverse Voltage: 3.3V; Height: 1.08mm; RoHS Compliant: Yes
J9 = X6511WV-12H-C60D30: Gold 250V 3A Square Pins 2.5mm 12P 260℃ 6mm -40℃~+105℃ 3mm 2.54mm Plugin Black Brass 2.54mm 1x12P Plugin,P=2.54mm Pin Headers ROHS; Manufacturer: XKB; Item Type: Male Header; Manufacturer Part Number: X6511WV-12H-C60D30; Package: Plugin,P=2.54mm; LCSC Part Number: C725944; ComponentLink1Description: LCSC; ComponentLink1URL: https://www.lcsc.com/product-detail/Pin-Headers_XKB-Connection-X6511WV-12H-C60D30_C725944.html
J10 = B8B-XH-A(LF)(SN): CONN HEADER VERT 8POS 2.5MM; Manufacturer: JST; Item Type: Wire to Board Connector; Contact Resistance: 20mR; Max Current Rating: 3A; Voltage Rating (AC): 250V; Number of Positions: 8; Insulation Resistance: 1GR; Wire/Cable Gauge: 22AWG; Supplier: Rs; LCSC Part Number: C157972; Manufacturer Part Number: B8B-XH-A(LF)(SN); RoHS: Yes; Stock: 14940; Mounting Technology: Through Hole; Contact Material: Brass; Contact Plating: Tin,Lead,Copper; Color: Natural; Housing Color: White; Housing Material: Polyamide; Weight: 28.349523g; Min Operating Temperature: -25°C; Max Operating Temperature: 85°C; Number of Rows: 1; Current Rating: 3A; Voltage Rating: 250V; Packaging: Bulk; Termination: Press-Fit; Fastening Type: Detent; Max Voltage Rating (AC): 250V; Number of Contacts: 8; Orientation: Straight; Series: XH; Contact Type: Male Pin; Length: 22.4mm; Lead Pitch: 2.5mm; Pitch: 2.5mm; Depth: 5.75mm; Reach SVHC Compliant: No; Lead Free: 5697LeadFree; ComponentLink1URL: https://datasheet.ciiva.com/11747/0900766b80826540-11747580.pdf?src-supplier=Rs; ComponentLink1Description: https://datasheet.ciiva.com/11747/0900766b80826540-11747580.pdf?src-supplier=Rs; ComponentLink2URL: https://datasheet.ciiva.com/26894/getdatasheetpartid-440408-26894817.pdf?src-supplier=Verical; ComponentLink2Description: https://datasheet.ciiva.com/26894/getdatasheetpartid-440408-26894817.pdf?src-supplier=Verical
J11 = X6521WV-2x04H-C60D30: Gold 250V 3A Policy 2.5mm 8P -40℃~+105℃ 2.54mm Double Row Black Brass 2.54mm 2x4P Plugin,P=2.54mm Pin Headers ROHS; Manufacturer: XKB; Item Type: Male Pin Header; Manufacturer Part Number: X6521WV-2x04H-C60D30; Package: Plugin,P=2.54mm; LCSC Part Number: C706894; ComponentLink1Description: LCSC; ComponentLink1URL: https://www.lcsc.com/product-detail/Pin-Headers_XKB-Connection-X6521WV-2x04H-C60D30_C706894.html?s_z=n_X6521WV-2x04H-C60D30
L8 = FNR4030S3R9MT: 2.3A 3.9uH ±20% 3.3A SMD,4x4mm Power Inductors ROHS; Manufacturer: cjiang; Manufacturer Part Number: FNR4030S3R9MT; Footprint: Custom; ComponentLink1Description: LCSC; ComponentLink1URL: https://www.lcsc.com/product-detail/Power-Inductors_cjiang-Changjiang-Microelectronics-Tech-FNR4030S3R9MT_C167872.html; LCSC Part Number: C167872; Item Type: Inductor
LED9 = NCD0603R3: RED LED 0603 Light Emitting Diodes; Manufacturer: Foshan NationStar Optoelectronics; Manufacturer Part Number: NCD0603R3; Package: 0603; Item Type: LED; LCSC Part Number: C3151730; ComponentLink1Description: LCSC; ComponentLink1URL: https://www.lcsc.com/product-detail/Light-Emitting-Diodes-LED_Foshan-NationStar-Optoelectronics-NCD0603R3_C3151730.html
LED10 = NCD0603Y2: yellow 0603 Light Emitting Diodes (LED) ROHS; Manufacturer: Foshan NationStar Optoelectronics; Manufacturer Part Number: NCD0603Y2; Package: 0603; LCSC Part Number: C89811; Item Type: LED; ComponentLink1Description: LCSC; ComponentLink1URL: https://www.lcsc.com/product-detail/Light-Emitting-Diodes-LED_Foshan-NationStar-Optoelectronics-NCD0603Y2_C89811.html
LED11 = 333-2SYGD/S530-E2-L: 333-2 Series Yellow Green 5 x 5.9 x 8.6 mm 30° 80 mcd Diffused 2.4 V LED; Manufacturer: Everlight; Supplier: Future Electronics; LCSC Part Number: C99697; Manufacturer Part Number: 333-2SYGD/S530-E2-L; Item Type: LED; Pricing: 500=0.0295, 2000=0.0286, 7500=0.0277, 20000=0.0271, 50000=0.0261 (USD); ComponentLink1URL: https://datasheet.octopart.com/333-2SYGD-S530-E2-L-Everlight-datasheet-27835065.pdf?src-supplier=Future+Electronics; ComponentLink1Description: https://datasheet.octopart.com/333-2SYGD-S530-E2-L-Everlight-datasheet-27835065.pdf?src-supplier=Future+Electronics
Q6 Q7 = DTC143ZETL: TRANS PREBIAS NPN 50V 0.1A EMT3; Manufacturer: Rohm; Item Type: Mosfet; Supplier: Mouser; LCSC Part Number: C111728; Manufacturer Part Number: DTC143ZETL; RoHS: Yes; Stock: 24993; Pricing: 1=0.24, 10=0.145, 50=0.145, 100=0.064, 1000=0.064, 10000=0.04 (USD); ComponentLink1URL: https://datasheet.ciiva.com/988/dtc143z-988064.pdf?src-supplier=Digikey; ComponentLink1Description: https://datasheet.ciiva.com/988/dtc143z-988064.pdf?src-supplier=Digikey; ComponentLink2URL: https://datasheet.ciiva.com/5781/dtc143ze-5781998.pdf?src-supplier=Farnell; ComponentLink2Description: https://datasheet.ciiva.com/5781/dtc143ze-5781998.pdf?src-supplier=Farnell; ComponentLink3URL: https://datasheet.ciiva.com/988/dtc143z-988062.pdf?src-supplier=Digikey; ComponentLink3Description: https://datasheet.ciiva.com/988/dtc143z-988062.pdf?src-supplier=Digikey; ComponentLink4URL: https://datasheet.ciiva.com/988/dtc143z-988063.pdf?src-supplier=Digikey; ComponentLink4Description: https://datasheet.ciiva.com/988/dtc143z-988063.pdf?src-supplier=Digikey
R115 = RC0402FR-074K7L: RES 4.7K OHM 1% 1/16W 0402; Manufacturer: Yageo; Voltage Rating (DC): 50V; Power Rating: 62.5mW; Resistance: 4.7kR; Temperature Coefficient: 100ppm/°C; Max Power Dissipation: 63mW; Item Type: Resistor; Supplier 1: Avnet; Manufacturer Part Number: RC0402FR-074K7L; RoHS: Yes; Category: Chip SMD Resistors; Stock 1: 2420000; Pricing 1: 10000=0.00085 (USD); Case/Package: 0402; Number of Pins: 2; Case Code (Imperial): 0402; Case Code (Metric): 1005; Size Code: 0402; Min Operating Temperature: -55°C; Max Operating Temperature: 155°C; Tolerance: 1%; Voltage Rating: 50V; Packaging: Tape and Reel; Resistor Type: Thick Film; Termination: SMD/SMT; Features: Moisture Resistant; Series: RC; Number of Terminations: 2; Resistance Tolerance: 1%; Construction: Rectangular; Length: 1mm; Width: 0.5mm; Height: 0.32mm; Depth: 0.5mm; Height - Seated (Max): 0.016inch; RoHS Compliant: Yes; Reach SVHC Compliant: Yes; Military Standard: Not; Lead Free: Lead Free; ComponentLink1URL: https://datasheet.ciiva.com/22661/1686128-22661342.pdf?src-supplier=Element14; ComponentLink1Description: https://datasheet.ciiva.com/22661/1686128-22661342.pdf?src-supplier=Element14; ComponentLink2URL: https://datasheet.ciiva.com/7850/1018594-7850022.pdf?src-supplier=Element14; ComponentLink2Description: https://datasheet.ciiva.com/7850/1018594-7850022.pdf?src-supplier=Element14; ComponentLink3URL: https://datasheet.ciiva.com/7850/1018594-7850023.pdf?src-supplier=Element14; ComponentLink3Description: https://datasheet.ciiva.com/7850/1018594-7850023.pdf?src-supplier=Element14; ComponentLink4URL: https://datasheet.ciiva.com/15215/getdatasheetpartid-328119-15215035.pdf?src-supplier=Verical; ComponentLink4Description: https://datasheet.ciiva.com/15215/getdatasheetpartid-328119-15215035.pdf?src-supplier=Verical; Supplier Part Number 1: RC0402FR-074K7L; LCSC Part Number: C105871
R116 = RC0402FR-07680RL: RES 680 OHM 1% 1/16W 0402; Manufacturer: Yageo; Temperature Coefficient: 100ppm/°C; Power Rating: 63mW; Voltage Rating: 50V; Item Type: Resistor; Supplier 1: Future Electronics; Manufacturer Part Number: RC0402FR-07680RL; RoHS: Yes; Category: Chip SMD Resistors; Stock 1: 5080000; Pricing 1: 10000=0.0011, 100000=0.0011, 300000=0.001, 750000=0.001, 2000000=0.0009 (USD); Case/Package: 0402; Case Code (Imperial): 0402; Case Code (Metric): 1005; Size Code: 0402; Min Operating Temperature: -55°C; Max Operating Temperature: 155°C; Resistance: 680R; Tolerance: 1%; Packaging: Tape and Reel; Resistor Type: Thick Film; Termination: SMD/SMT; Features: Moisture Resistant; Series: RC; Max Power Dissipation: 63mW; Number of Terminations: 2; Resistance Tolerance: 1%; Construction: Rectangular; Voltage Rating (AC): 50V; Length: 1mm; Depth: 0.5mm; Reach SVHC Compliant: No; Lead Free: Lead Free; Military Standard: Not; RoHS Compliant: Yes; ComponentLink1URL: https://datasheet.ciiva.com/12667/pyu-rc0402-51-rohs-l-6-r-12667916.pdf?src-supplier=Mouser; ComponentLink1Description: https://datasheet.ciiva.com/12667/pyu-rc0402-51-rohs-l-6-r-12667916.pdf?src-supplier=Mouser; ComponentLink2URL: https://datasheet.ciiva.com/7850/1018594-7850071.pdf?src-supplier=Element14; ComponentLink2Description: https://datasheet.ciiva.com/7850/1018594-7850071.pdf?src-supplier=Element14; ComponentLink3URL: https://datasheet.ciiva.com/7850/1018594-7850070.pdf?src-supplier=Element14; ComponentLink3Description: https://datasheet.ciiva.com/7850/1018594-7850070.pdf?src-supplier=Element14; ComponentLink4URL: https://datasheet.ciiva.com/17042/pyu-rc0402-51-rohs-l-6-r-17042399.pdf?src-supplier=Future+Electronics; ComponentLink4Description: https://datasheet.ciiva.com/17042/pyu-rc0402-51-rohs-l-6-r-17042399.pdf?src-supplier=Future+Electronics; Supplier Part Number 1: 7948052
R117 = RC0402FR-070RL: RES 0 OHM JUMPER 1/16W 0402; Manufacturer: Yageo; Item Type: Resistors; Tolerance: 1%; Power Rating: 62.5mW; Voltage Rating: 50V; Temperature Coefficient: 200ppm/°C; Max Power Dissipation: 63mW; Supplier 1: Mouser; Manufacturer Part Number: RC0402FR-070RL; RoHS: Yes; Stock 1: 8556842; Pricing 1: 1=0.10000, 10=0.01400, 50=0.01400, 100=0.00600, 1000=0.00300, 5000=0.00200, 10000=0.00100 (USD); Mount: Surface Mount; Case/Package: 0402; Contact Plating: Tin,Matte; Case Code (Imperial): 0402; Case Code (Metric): 1005; Size Code: 0402; Min Operating Temperature: -55°C; Max Operating Temperature: 155°C; Resistance: 0R; Resistor Type: Thick Film; Packaging: Tape and Reel; Termination: SMD/SMT; Features: Moisture Resistant; Series: RC; Number of Terminations: 2; Length: 1mm; Width: 0.5mm; Height: 0.35mm; Radiation Hardening: No; Lead Free: Lead Free; RoHS Compliant: Yes; ComponentLink1URL: https://datasheet.ciiva.com/8896/pyu-rc0402-51-rohs-l-6-8896149.pdf?src-supplier=Avnet; ComponentLink1Description: https://datasheet.ciiva.com/8896/pyu-rc0402-51-rohs-l-6-8896149.pdf?src-supplier=Avnet; ComponentLink2URL: https://datasheet.ciiva.com/16790/pyu-rc0402-51-rohs-l-6-r-16790444.pdf?src-supplier=Future+Electronics; ComponentLink2Description: https://datasheet.ciiva.com/16790/pyu-rc0402-51-rohs-l-6-r-16790444.pdf?src-supplier=Future+Electronics; Supplier Part Number 1: 603-RC0402FR-070RL; LCSC Part Number: C106231
R118 R119 = RC0603FR-070RL: RES SMD 0R, 1%, 0.1W, 0603; Manufacturer: Yageo; Item Type: Resistor; Manufacturer Part Number: RC0603FR-070RL; Package: 0603; LCSC Part Number: C100044; ComponentLink9Description: LCSC; ComponentLink9URL: https://www.lcsc.com/product-detail/Chip-Resistor-Surface-Mount_YAGEO-RC0603FR-070RL_C100044.html
R120 R121 = RC0603FR-07680RL: RES SMD 680 OHM 1% 1/10W 0603; Manufacturer: Yageo; Item Type: Resistor; Manufacturer Part Number: RC0603FR-07680RL; Package: 0603; ComponentLink4URL: https://www.lcsc.com/product-detail/Chip-Resistor-Surface-Mount_YAGEO-RC0603FR-07680RL_C112310.html; ComponentLink4Description: LCSC; LCSC Part Number: C112310
R123-R127 = RC0603FR-0720KL: RES 20K OHM 1% 1/10W 0603; Manufacturer: Yageo; Resistance: 20kR; Temperature Coefficient: 100ppm/°C; Voltage Rating (DC): 50V; Power Rating: 100mW; Item Type: Resistor; Supplier 1: Arrow Electronics; Manufacturer Part Number: RC0603FR-0720KL; RoHS: Yes; Category: Chip SMD Resistors; Stock 1: 945000; Pricing 1: 5000=0.00240, 10000=0.00220, 25000=0.00200, 50000=0.00190, 125000=0.00180 (USD); Case/Package: 0603; Number of Pins: 2; Case Code (Imperial): 0603; Case Code (Metric): 1608; Size Code: 0603; Min Operating Temperature: -55°C; Max Operating Temperature: 155°C; Tolerance: 1%; Packaging: Tape and Reel; Resistor Type: Thick Film; Voltage Rating: 50V; Package Quantity: 1; Termination: SMD/SMT; Number of Terminations: 2; Max Power Dissipation: 100mW; Features: Moisture Resistant; Series: RC; Technology: THICK FILM; Construction: Rectangular; Resistance Tolerance: 1%; Length: 0.063inch; Width: 0.031inch; Height: 0.022inch; Depth: 0.8mm; Lead Free: Lead Free; RoHS Compliant: Yes; REACH SVHC: No SVHC; Military Standard: Not; ComponentLink1URL: https://datasheet.ciiva.com/11808/0900766b80f96399-11808275.pdf?src-supplier=RSComponents; ComponentLink1Description: https://datasheet.ciiva.com/11808/0900766b80f96399-11808275.pdf?src-supplier=RSComponents; ComponentLink2URL: https://datasheet.ciiva.com/22747/443971-22747525.pdf?src-supplier=Element14; ComponentLink2Description: https://datasheet.ciiva.com/22747/443971-22747525.pdf?src-supplier=Element14; ComponentLink3URL: https://datasheet.ciiva.com/2453/pyu-r-int-thick-7-2453911.pdf?src-supplier=Digi-Key; ComponentLink3Description: https://datasheet.ciiva.com/2453/pyu-r-int-thick-7-2453911.pdf?src-supplier=Digi-Key; ComponentLink4URL: https://datasheet.ciiva.com/2453/pyu-r-int-thick-7-2453912.pdf?src-supplier=Digi-Key; ComponentLink4Description: https://datasheet.ciiva.com/2453/pyu-r-int-thick-7-2453912.pdf?src-supplier=Digi-Key; ComponentLink5URL: https://datasheet.ciiva.com/2453/pyu-r-int-thick-7-2453910.pdf?src-supplier=Digi-Key; ComponentLink5Description: https://datasheet.ciiva.com/2453/pyu-r-int-thick-7-2453910.pdf?src-supplier=Digi-Key; Supplier Part Number 1: RC0603FR-0720KL; LCSC Part Number: C105575
U16 = PCA9557PW,118: IC XPND 400KHZ I2C SMBUS 16TSSOP; Manufacturer: NXP Semiconductors; Interface: I2C,SMBus,Serial; Min Supply Voltage: 2.3V; Max Supply Voltage: 5.5V; Output Current: 50mA; Number of I/Os: 8; Max Power Dissipation: 200mW; Supply Current: 85mA; Supplier: Arrow Electronics; LCSC Part Number: C141380; Manufacturer Part Number: PCA9557PW,118; RoHS: Yes; Item Type: IC; Stock: 2962; Pricing: 1=1.5161, 10=1.0131, 25=1.0025, 100=0.8766, 250=0.812, 500=0.7757, 1000=0.7025 (USD); Mounting Technology: Surface Mount; Case/Package: TSSOP; Pins: 16; Weight: 0.006102oz; Min Operating Temperature: -40°C; Max Operating Temperature: 85°C; Packaging: Tape and Reel; Package Quantity: 1; Frequency: 400kHz; Clock Frequency: 400kHz; Series: -; Nominal Supply Voltage: 5.5V; Radiation Hardening: No; Lead Free: Lead Free; RoHS Compliant: Yes; ComponentLink1URL: https://datasheet.ciiva.com/46390/1786003-46390826.pdf?src-supplier=Element14; ComponentLink1Description: https://datasheet.ciiva.com/46390/1786003-46390826.pdf?src-supplier=Element14; ComponentLink2URL: https://datasheet.ciiva.com/1779/pca9557-1779992.pdf?src-supplier=Digikey; ComponentLink2Description: https://datasheet.ciiva.com/1779/pca9557-1779992.pdf?src-supplier=Digikey; ComponentLink3URL: https://datasheet.ciiva.com/1779/pca9557-1779991.pdf?src-supplier=Digikey; ComponentLink3Description: https://datasheet.ciiva.com/1779/pca9557-1779991.pdf?src-supplier=Digikey; ComponentLink4URL: https://datasheet.ciiva.com/1779/pca9557-1779993.pdf?src-supplier=Digikey; ComponentLink4Description: https://datasheet.ciiva.com/1779/pca9557-1779993.pdf?src-supplier=Digikey; ComponentLink5URL: https://datasheet.ciiva.com/8123/pca9557-8123482.pdf?src-supplier=Avnet; ComponentLink5Description: https://datasheet.ciiva.com/8123/pca9557-8123482.pdf?src-supplier=Avnet; ComponentLink6URL: https://datasheet.ciiva.com/16219/pca9557-16219951.pdf?src-supplier=Future+Electronics; ComponentLink6Description: https://datasheet.ciiva.com/16219/pca9557-16219951.pdf?src-supplier=Future+Electronics; ComponentLink7URL: https://datasheet.ciiva.com/8125/pca9557-8125431.pdf?src-supplier=Avnet; ComponentLink7Description: https://datasheet.ciiva.com/8125/pca9557-8125431.pdf?src-supplier=Avnet
U18 = ISO6742FDWR: DG ISO 5KV 4CH CAN/RS232 16-SOIC; Manufacturer: Texas Instruments; Item Type: IC; Supplier: Digikey; LCSC Part Number: C5216408; Manufacturer Part Number: ISO6742FDWR; RoHS: No; Stock: 6799; Pricing: 1=2.23, 10=1.651, 25=1.506, 100=1.3468, 250=1.27092, 500=1.2252, 1000=1.18756 (USD)
U19 = VRB1212S-10WR3: 10W wide-voltage input, isolated and regulated single-channel/positive-negative dual-channel output DC/DC power supply module; Manufacturer: YLPTEC; Manufacturer Part Number: VRB1212S-10WR3; Package: DIP; LCSC Part Number: C7468825; Item Type: Module; ComponentLink1Description: LCSC; ComponentLink1URL: https://www.lcsc.com/product-detail/C7468825.html?s_z=n_VRB1212S-10WR3
U20 = AP63203WU-7: IC REG BUCK 3.3V 2A TSOT26; Manufacturer: Diodes; Supplier: Future Electronics; Supplier Part Number: 6109504; Manufacturer Part Number: AP63203WU-7; RoHS: Yes; Category: Voltage Regulators - Switching; Stock: 3000; Pricing: 3000=0.34, 6000=0.335, 9000=0.33, 12000=0.33, 15000=0.32 (USD); ComponentLink1URL: https://www.diodes.com/assets/Datasheets/AP63200-AP63201-AP63203-AP63205.pdf?src-supplier=Digi-Key; ComponentLink1Description: https://www.diodes.com/assets/Datasheets/AP63200-AP63201-AP63203-AP63205.pdf?src-supplier=Digi-Key; LCSC Part Number: C780769; Item Type: IC

## Nets that join several sheets
1.1V-HUB: Power-Sheet (6 pins), GSM-USB-HUB-Sheet (FB2.1)
3.3V-HUB: Power-Sheet (10 pins), GSM-USB-HUB-Sheet (FB1.1 R92.2 R94.2)
12V: Power-Sheet (5 pins), Others-Sheet (C156.2 C157.1 U19.6)
+1.2V: Microprocessor-Sheet (R34.1), Power-Sheet (6 pins)
+1.8V: Microprocessor-Sheet (R38.1), Power-Sheet (6 pins)
+3.0V: Microprocessor-Sheet (R11.2 R32.1), Power-Sheet (C88.2 R79.2 U9.2)
+3.3V: Microprocessor-Sheet (16 pins), Power-Sheet (10 pins), RGB-LCD-Sheet (6 pins), GSM-USB-HUB-Sheet (C140.2 U15.19), Others-Sheet (10 pins)
+3.8V: Power-Sheet (6 pins), GSM-USB-HUB-Sheet (18 pins)
+5V: Microprocessor-Sheet (J2.1), Power-Sheet (25 pins), RGB-LCD-Sheet (5 pins), GSM-USB-HUB-Sheet (C104.2 R88.1 R96.2)
+USIM: Microprocessor-Sheet (J2.4 J2.5), GSM-USB-HUB-Sheet (U14.14)
GND: Microprocessor-Sheet (88 pins), Power-Sheet (76 pins), RGB-LCD-Sheet (30 pins), GSM-USB-HUB-Sheet (114 pins), Others-Sheet (18 pins)
V3S_RST: Microprocessor-Sheet (6 pins), Others-Sheet (R119.2)
GSM_PWR: GSM-USB-HUB-Sheet (Q4.2), Others-Sheet (R117.1)
GSM_RST: Microprocessor-Sheet (U1.42), GSM-USB-HUB-Sheet (Q5.2)
I2C0_SCL: Microprocessor-Sheet (R18.2 U1.45 U3.6), RGB-LCD-Sheet (U11.10), Others-Sheet (J9.3 U16.1)
I2C0_SDA: Microprocessor-Sheet (R19.2 U1.46 U3.5), RGB-LCD-Sheet (U11.9), Others-Sheet (J9.2 U16.2)
LCD_CLK: Microprocessor-Sheet (U1.37), RGB-LCD-Sheet (J4.30)
LCD_D2: Microprocessor-Sheet (U1.33), RGB-LCD-Sheet (J4.23)
LCD_D3: Microprocessor-Sheet (U1.32), RGB-LCD-Sheet (J4.24)
LCD_D4: Microprocessor-Sheet (U1.31), RGB-LCD-Sheet (J4.25)
LCD_D5: Microprocessor-Sheet (U1.30), RGB-LCD-Sheet (J4.26)
LCD_D6: Microprocessor-Sheet (U1.28), RGB-LCD-Sheet (J4.27)
LCD_D7: Microprocessor-Sheet (U1.27), RGB-LCD-Sheet (J4.28)
LCD_D10: Microprocessor-Sheet (U1.24), RGB-LCD-Sheet (J4.15)
LCD_D11: Microprocessor-Sheet (U1.23), RGB-LCD-Sheet (J4.16)
LCD_D12: Microprocessor-Sheet (U1.22), RGB-LCD-Sheet (J4.17)
LCD_D13: Microprocessor-Sheet (U1.18), RGB-LCD-Sheet (J4.18)
LCD_D14: Microprocessor-Sheet (U1.17), RGB-LCD-Sheet (J4.19)
LCD_D15: Microprocessor-Sheet (U1.16), RGB-LCD-Sheet (J4.20)
LCD_D18: Microprocessor-Sheet (U1.15), RGB-LCD-Sheet (J4.7)
LCD_D19: Microprocessor-Sheet (U1.14), RGB-LCD-Sheet (J4.8)
LCD_D20: Microprocessor-Sheet (U1.13), RGB-LCD-Sheet (J4.9)
LCD_D21: Microprocessor-Sheet (U1.11), RGB-LCD-Sheet (J4.10)
LCD_D22: Microprocessor-Sheet (U1.7), RGB-LCD-Sheet (J4.11)
LCD_D23: Microprocessor-Sheet (U1.6), RGB-LCD-Sheet (J4.12)
LCD_DE: Microprocessor-Sheet (U1.36), RGB-LCD-Sheet (J4.34)
LCD_HSYNC: Microprocessor-Sheet (U1.35), RGB-LCD-Sheet (J4.32)
LCD_PB2: Microprocessor-Sheet (U1.41), RGB-LCD-Sheet (R83.1)
LCD_VSYNC: Microprocessor-Sheet (U1.34), RGB-LCD-Sheet (J4.33)
MCU_RST: Microprocessor-Sheet (U1.44), Others-Sheet (U18.11)
PE20: Microprocessor-Sheet (U1.10), Others-Sheet (J11.4)
PG0: Microprocessor-Sheet (U1.5), Others-Sheet (J11.7 R117.2)
PG1: Microprocessor-Sheet (U1.4), Others-Sheet (J11.5)
PG2: Microprocessor-Sheet (U1.3), Others-Sheet (J11.3)
PG3: Microprocessor-Sheet (U1.2), Others-Sheet (J11.1)
PG5: Microprocessor-Sheet (U1.128), Others-Sheet (J11.2)
UART1_RX: Microprocessor-Sheet (U1.8), Others-Sheet (Q7.2 U18.14)
UART1_TX: Microprocessor-Sheet (U1.9), Others-Sheet (Q6.2 U18.12)
UART2_RX: Microprocessor-Sheet (U1.40), GSM-USB-HUB-Sheet (U15.16)
UART2_TX: Microprocessor-Sheet (U1.39), GSM-USB-HUB-Sheet (U15.17)
USB-D_N: Microprocessor-Sheet (U1.110), GSM-USB-HUB-Sheet (U13.27)
USB-D_P: Microprocessor-Sheet (U1.111), GSM-USB-HUB-Sheet (U13.26)
USB-PD-D_N: Microprocessor-Sheet (J2.2), GSM-USB-HUB-Sheet (U13.15)
USB-PD-D_P: Microprocessor-Sheet (J2.3), GSM-USB-HUB-Sheet (U13.14)
USIM_CLK: Microprocessor-Sheet (J2.7), GSM-USB-HUB-Sheet (U14.16)
USIM_DATA: Microprocessor-Sheet (J2.8), GSM-USB-HUB-Sheet (U14.15)
USIM_RST: Microprocessor-Sheet (J2.6), GSM-USB-HUB-Sheet (U14.17)